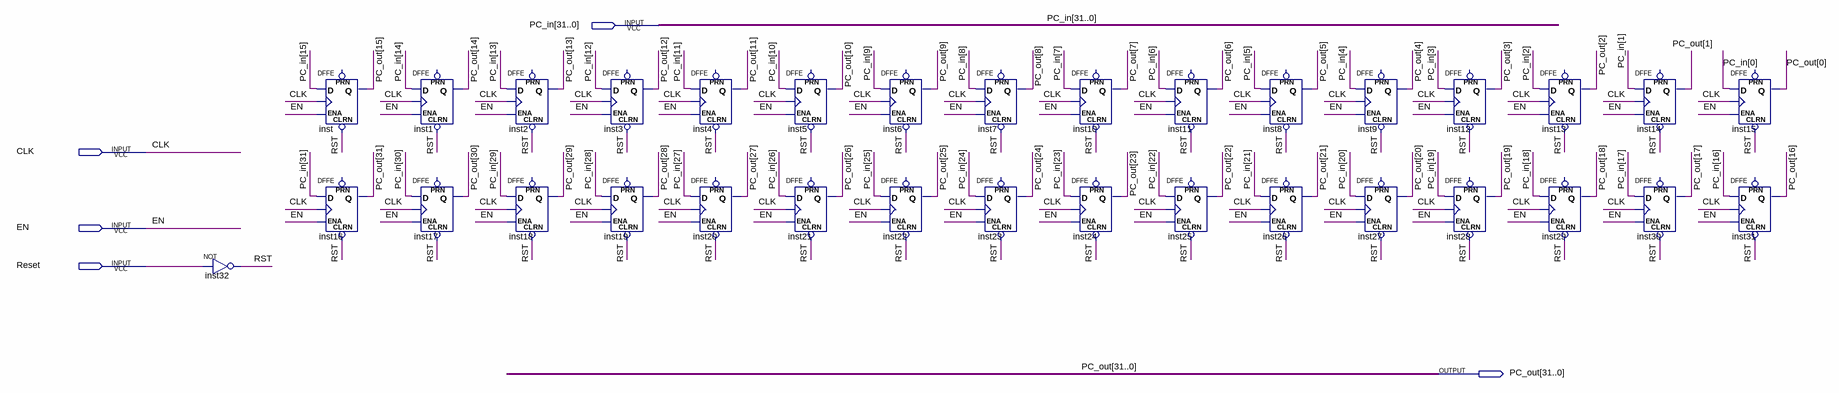
[diagram p0: schematic sheet]
// Quartus schematic PC.bdf as structural Verilog: 33 symbols, 5 pins
module PC (
  input  [31:0] PC_in,
  input  CLK,
  input  EN,
  input  Reset,
  output [31:0] PC_out
);

  wire RST;

  not inst32 (RST, Reset);
  DFFE inst (.CLRN(RST), .D(PC_in[15]), .CLK(CLK), .ENA(EN), .Q(PC_out[15]));  // open: PRN
  DFFE inst16 (.CLRN(RST), .D(PC_in[31]), .CLK(CLK), .ENA(EN), .Q(PC_out[31]));  // open: PRN
  DFFE inst1 (.CLRN(RST), .D(PC_in[14]), .CLK(CLK), .ENA(EN), .Q(PC_out[14]));  // open: PRN
  DFFE inst17 (.CLRN(RST), .D(PC_in[30]), .CLK(CLK), .ENA(EN), .Q(PC_out[30]));  // open: PRN
  DFFE inst2 (.CLRN(RST), .D(PC_in[13]), .CLK(CLK), .ENA(EN), .Q(PC_out[13]));  // open: PRN
  DFFE inst18 (.CLRN(RST), .D(PC_in[29]), .CLK(CLK), .ENA(EN), .Q(PC_out[29]));  // open: PRN
  DFFE inst3 (.CLRN(RST), .D(PC_in[12]), .CLK(CLK), .ENA(EN), .Q(PC_out[12]));  // open: PRN
  DFFE inst19 (.CLRN(RST), .D(PC_in[28]), .CLK(CLK), .ENA(EN), .Q(PC_out[28]));  // open: PRN
  DFFE inst4 (.CLRN(RST), .D(PC_in[11]), .CLK(CLK), .ENA(EN), .Q(PC_out[11]));  // open: PRN
  DFFE inst20 (.CLRN(RST), .D(PC_in[27]), .CLK(CLK), .ENA(EN), .Q(PC_out[27]));  // open: PRN
  DFFE inst5 (.CLRN(RST), .D(PC_in[10]), .CLK(CLK), .ENA(EN), .Q(PC_out[10]));  // open: PRN
  DFFE inst21 (.CLRN(RST), .D(PC_in[26]), .CLK(CLK), .ENA(EN), .Q(PC_out[26]));  // open: PRN
  DFFE inst6 (.CLRN(RST), .D(PC_in[9]), .CLK(CLK), .ENA(EN), .Q(PC_out[9]));  // open: PRN
  DFFE inst22 (.CLRN(RST), .D(PC_in[25]), .CLK(CLK), .ENA(EN), .Q(PC_out[25]));  // open: PRN
  DFFE inst7 (.CLRN(RST), .D(PC_in[8]), .CLK(CLK), .ENA(EN), .Q(PC_out[8]));  // open: PRN
  DFFE inst23 (.CLRN(RST), .D(PC_in[24]), .CLK(CLK), .ENA(EN), .Q(PC_out[24]));  // open: PRN
  DFFE inst10 (.CLRN(RST), .D(PC_in[7]), .CLK(CLK), .ENA(EN), .Q(PC_out[7]));  // open: PRN
  DFFE inst24 (.CLRN(RST), .D(PC_in[23]), .CLK(CLK), .ENA(EN), .Q(PC_out[23]));  // open: PRN
  DFFE inst11 (.CLRN(RST), .D(PC_in[6]), .CLK(CLK), .ENA(EN), .Q(PC_out[6]));  // open: PRN
  DFFE inst25 (.CLRN(RST), .D(PC_in[22]), .CLK(CLK), .ENA(EN), .Q(PC_out[22]));  // open: PRN
  DFFE inst8 (.CLRN(RST), .D(PC_in[5]), .CLK(CLK), .ENA(EN), .Q(PC_out[5]));  // open: PRN
  DFFE inst26 (.CLRN(RST), .D(PC_in[21]), .CLK(CLK), .ENA(EN), .Q(PC_out[21]));  // open: PRN
  DFFE inst9 (.CLRN(RST), .D(PC_in[4]), .CLK(CLK), .ENA(EN), .Q(PC_out[4]));  // open: PRN
  DFFE inst27 (.CLRN(RST), .D(PC_in[20]), .CLK(CLK), .ENA(EN), .Q(PC_out[20]));  // open: PRN
  DFFE inst12 (.CLRN(RST), .D(PC_in[3]), .CLK(CLK), .ENA(EN), .Q(PC_out[3]));  // open: PRN
  DFFE inst28 (.CLRN(RST), .D(PC_in[19]), .CLK(CLK), .ENA(EN), .Q(PC_out[19]));  // open: PRN
  DFFE inst13 (.CLRN(RST), .D(PC_in[2]), .CLK(CLK), .ENA(EN), .Q(PC_out[2]));  // open: PRN
  DFFE inst29 (.CLRN(RST), .D(PC_in[18]), .CLK(CLK), .ENA(EN), .Q(PC_out[18]));  // open: PRN
  DFFE inst14 (.CLRN(RST), .D(PC_in[1]), .CLK(CLK), .ENA(EN), .Q(PC_out[1]));  // open: PRN
  DFFE inst30 (.CLRN(RST), .D(PC_in[17]), .CLK(CLK), .ENA(EN), .Q(PC_out[17]));  // open: PRN
  DFFE inst15 (.CLRN(RST), .D(PC_in[0]), .CLK(CLK), .ENA(EN), .Q(PC_out[0]));  // open: PRN
  DFFE inst31 (.CLRN(RST), .D(PC_in[16]), .CLK(CLK), .ENA(EN), .Q(PC_out[16]));  // open: PRN
endmodule
